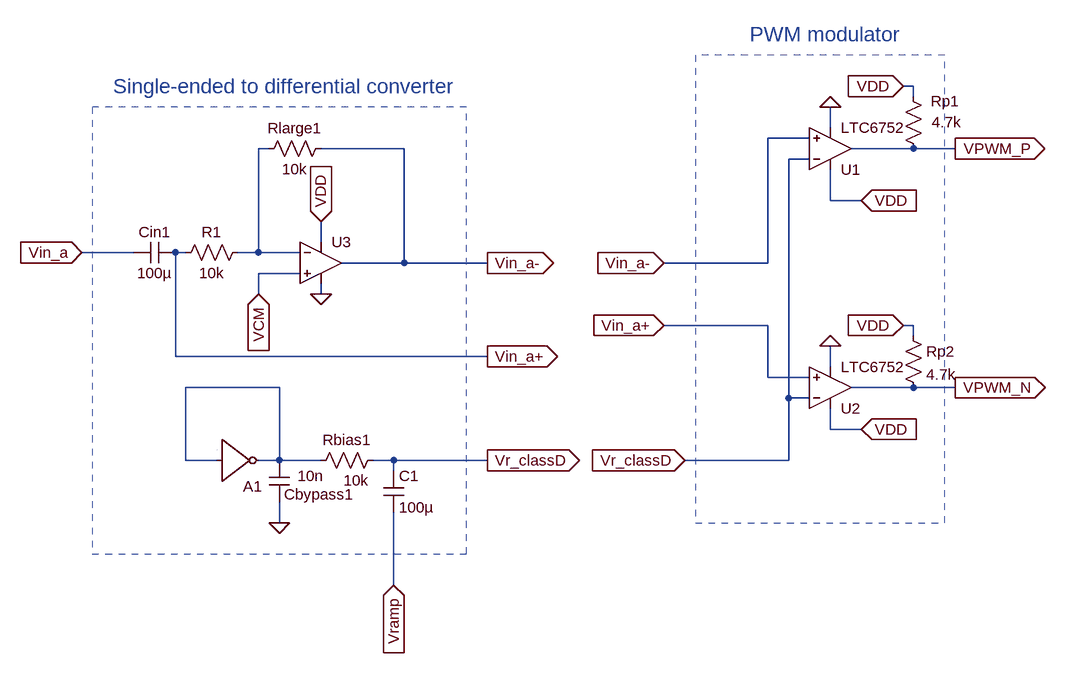
[diagram p0: schematic exp4-block.asc]
exp4-block.asc, the LTspice schematic file:
Version 4
SHEET 1 1248 756
WIRE 1040 -128 1024 -128
WIRE 1040 -112 1040 -128
WIRE 912 -64 912 -96
WIRE 880 -48 816 -48
WIRE 48 -32 32 -32
WIRE 256 -32 128 -32
WIRE 1040 -32 944 -32
WIRE 1104 -32 1040 -32
WIRE 880 -16 848 -16
WIRE 912 48 912 0
WIRE 960 48 912 48
WIRE 128 112 128 80
WIRE -160 128 -240 128
WIRE -80 128 -96 128
WIRE 32 128 32 -32
WIRE 32 128 0 128
WIRE 96 128 32 128
WIRE 256 144 256 -32
WIRE 256 144 160 144
WIRE 384 144 256 144
WIRE 816 144 816 -48
WIRE 816 144 656 144
WIRE 96 160 32 160
WIRE 32 192 32 160
WIRE 128 192 128 176
WIRE 816 240 656 240
WIRE 1040 240 1024 240
WIRE 1040 256 1040 240
WIRE -96 288 -96 128
WIRE 384 288 -96 288
WIRE 912 304 912 272
WIRE 816 320 816 240
WIRE 880 320 816 320
WIRE 64 336 -80 336
WIRE 1040 336 944 336
WIRE 1104 336 1040 336
WIRE 848 352 848 -16
WIRE 880 352 848 352
WIRE 912 400 912 368
WIRE 960 400 912 400
WIRE -80 448 -80 336
WIRE -32 448 -80 448
WIRE 64 448 64 336
WIRE 64 448 32 448
WIRE 128 448 64 448
WIRE 240 448 208 448
WIRE 384 448 240 448
WIRE 848 448 848 352
WIRE 848 448 688 448
WIRE 240 464 240 448
WIRE 64 544 64 512
WIRE 240 640 240 528
FLAG 384 144 Vin_a-
IOPIN 384 144 Out
FLAG 384 288 Vin_a+
IOPIN 384 288 Out
FLAG 384 448 Vr_classD
IOPIN 384 448 Out
FLAG -240 128 Vin_a
IOPIN -240 128 In
FLAG 64 544 0
FLAG 240 640 Vramp
IOPIN 240 640 In
FLAG 656 144 Vin_a-
IOPIN 656 144 In
FLAG 656 240 Vin_a+
IOPIN 656 240 In
FLAG 1104 -32 VPWM_P
IOPIN 1104 -32 Out
FLAG 1104 336 VPWM_N
IOPIN 1104 336 Out
FLAG 688 448 Vr_classD
IOPIN 688 448 In
FLAG 912 -96 0
FLAG 912 272 0
FLAG 960 48 VDD
IOPIN 960 48 In
FLAG 960 400 VDD
IOPIN 960 400 In
FLAG 1024 -128 VDD
IOPIN 1024 -128 In
FLAG 1024 240 VDD
IOPIN 1024 240 In
FLAG 32 192 VCM
IOPIN 32 192 In
FLAG 128 192 0
FLAG 128 80 VDD
IOPIN 128 80 In
SYMBOL res 144 -48 R90
WINDOW 0 0 56 VBottom 2
WINDOW 3 32 56 VTop 2
SYMATTR InstName Rlarge1
SYMATTR Value 10k
SYMBOL cap -96 112 R90
WINDOW 0 0 32 VBottom 2
WINDOW 3 32 32 VTop 2
SYMATTR InstName Cin1
SYMATTR Value 100µ
SYMBOL res 224 432 R90
WINDOW 0 0 56 VBottom 2
WINDOW 3 31 42 VTop 2
SYMATTR InstName Rbias1
SYMATTR Value 10k
SYMBOL cap 48 448 R0
WINDOW 0 23 52 Left 2
WINDOW 3 44 24 Left 2
SYMATTR InstName Cbypass1
SYMATTR Value 10n
SYMBOL cap 224 464 R0
SYMATTR InstName C1
SYMATTR Value 100µ
SYMBOL res 1024 -128 R0
WINDOW 0 43 23 Left 2
WINDOW 3 44 55 Left 2
SYMATTR InstName Rp1
SYMATTR Value 4.7k
SYMBOL res 1024 240 R0
SYMATTR InstName Rp2
SYMATTR Value 4.7k
SYMBOL Comparators/LTC6752 912 32 M180
SYMATTR InstName U1
SYMBOL Comparators/LTC6752 912 400 M180
SYMATTR InstName U2
SYMBOL res 16 112 R90
WINDOW 0 0 56 VBottom 2
WINDOW 3 32 56 VTop 2
SYMATTR InstName R1
SYMATTR Value 10k
SYMBOL Opamps/UniversalOpamp2 128 144 R0
SYMATTR InstName U3
SYMBOL inv -32 512 M180
WINDOW 3 0 0 Invisible 0
SYMATTR Value Vhigh=5 Vlow=0
SYMATTR InstName A1
SYMATTR Value2 Trise=1p Tfall=1p Td=1p
TEXT 904 -208 Center 3 ;PWM modulator
TEXT 72 -128 Center 3 ;Single-ended to differential converter
RECTANGLE Normal 704 544 1088 -176 2
RECTANGLE Normal -224 592 352 -96 2

The netlist it stands for:
* exp4-block.asc
Rlarge1 Vin_a- N001 10k
Cin1 Vin_a+ Vin_a 100µ
Rbias1 Vr_classD N002 10k
Cbypass1 N002 0 10n
C1 Vr_classD Vramp 100µ
Rp1 VDD VPWM_P 4.7k
Rp2 VDD VPWM_N 4.7k
XU1 Vin_a- Vr_classD VDD 0 VPWM_P LTC6752  ; pins In+ In- V+ V- OUT
XU2 Vin_a+ Vr_classD VDD 0 VPWM_N LTC6752  ; pins In+ In- V+ V- OUT
R1 N001 Vin_a+ 10k
XU3 VCM N001 VDD 0 Vin_a- level.2 Avol=1Meg GBW=10Meg Slew=10Meg ilimit=25m rail=0 Vos=0 phimargin=45 en=0 enk=0 in=0 ink=0 Rin=500Meg  ; pins IN+ IN- V+ V- OUT
A1 N002 0 0 0 0 N002 0 0 BUF Vhigh=5 Vlow=0 Trise=1p Tfall=1p Td=1p
* PWM modulator
* Single-ended to differential converter
.lib LTC7.lib
.lib UniversalOpamps2.sub
.backanno
.end